# EAGLE design source_eagle (EAGLE 6.3)
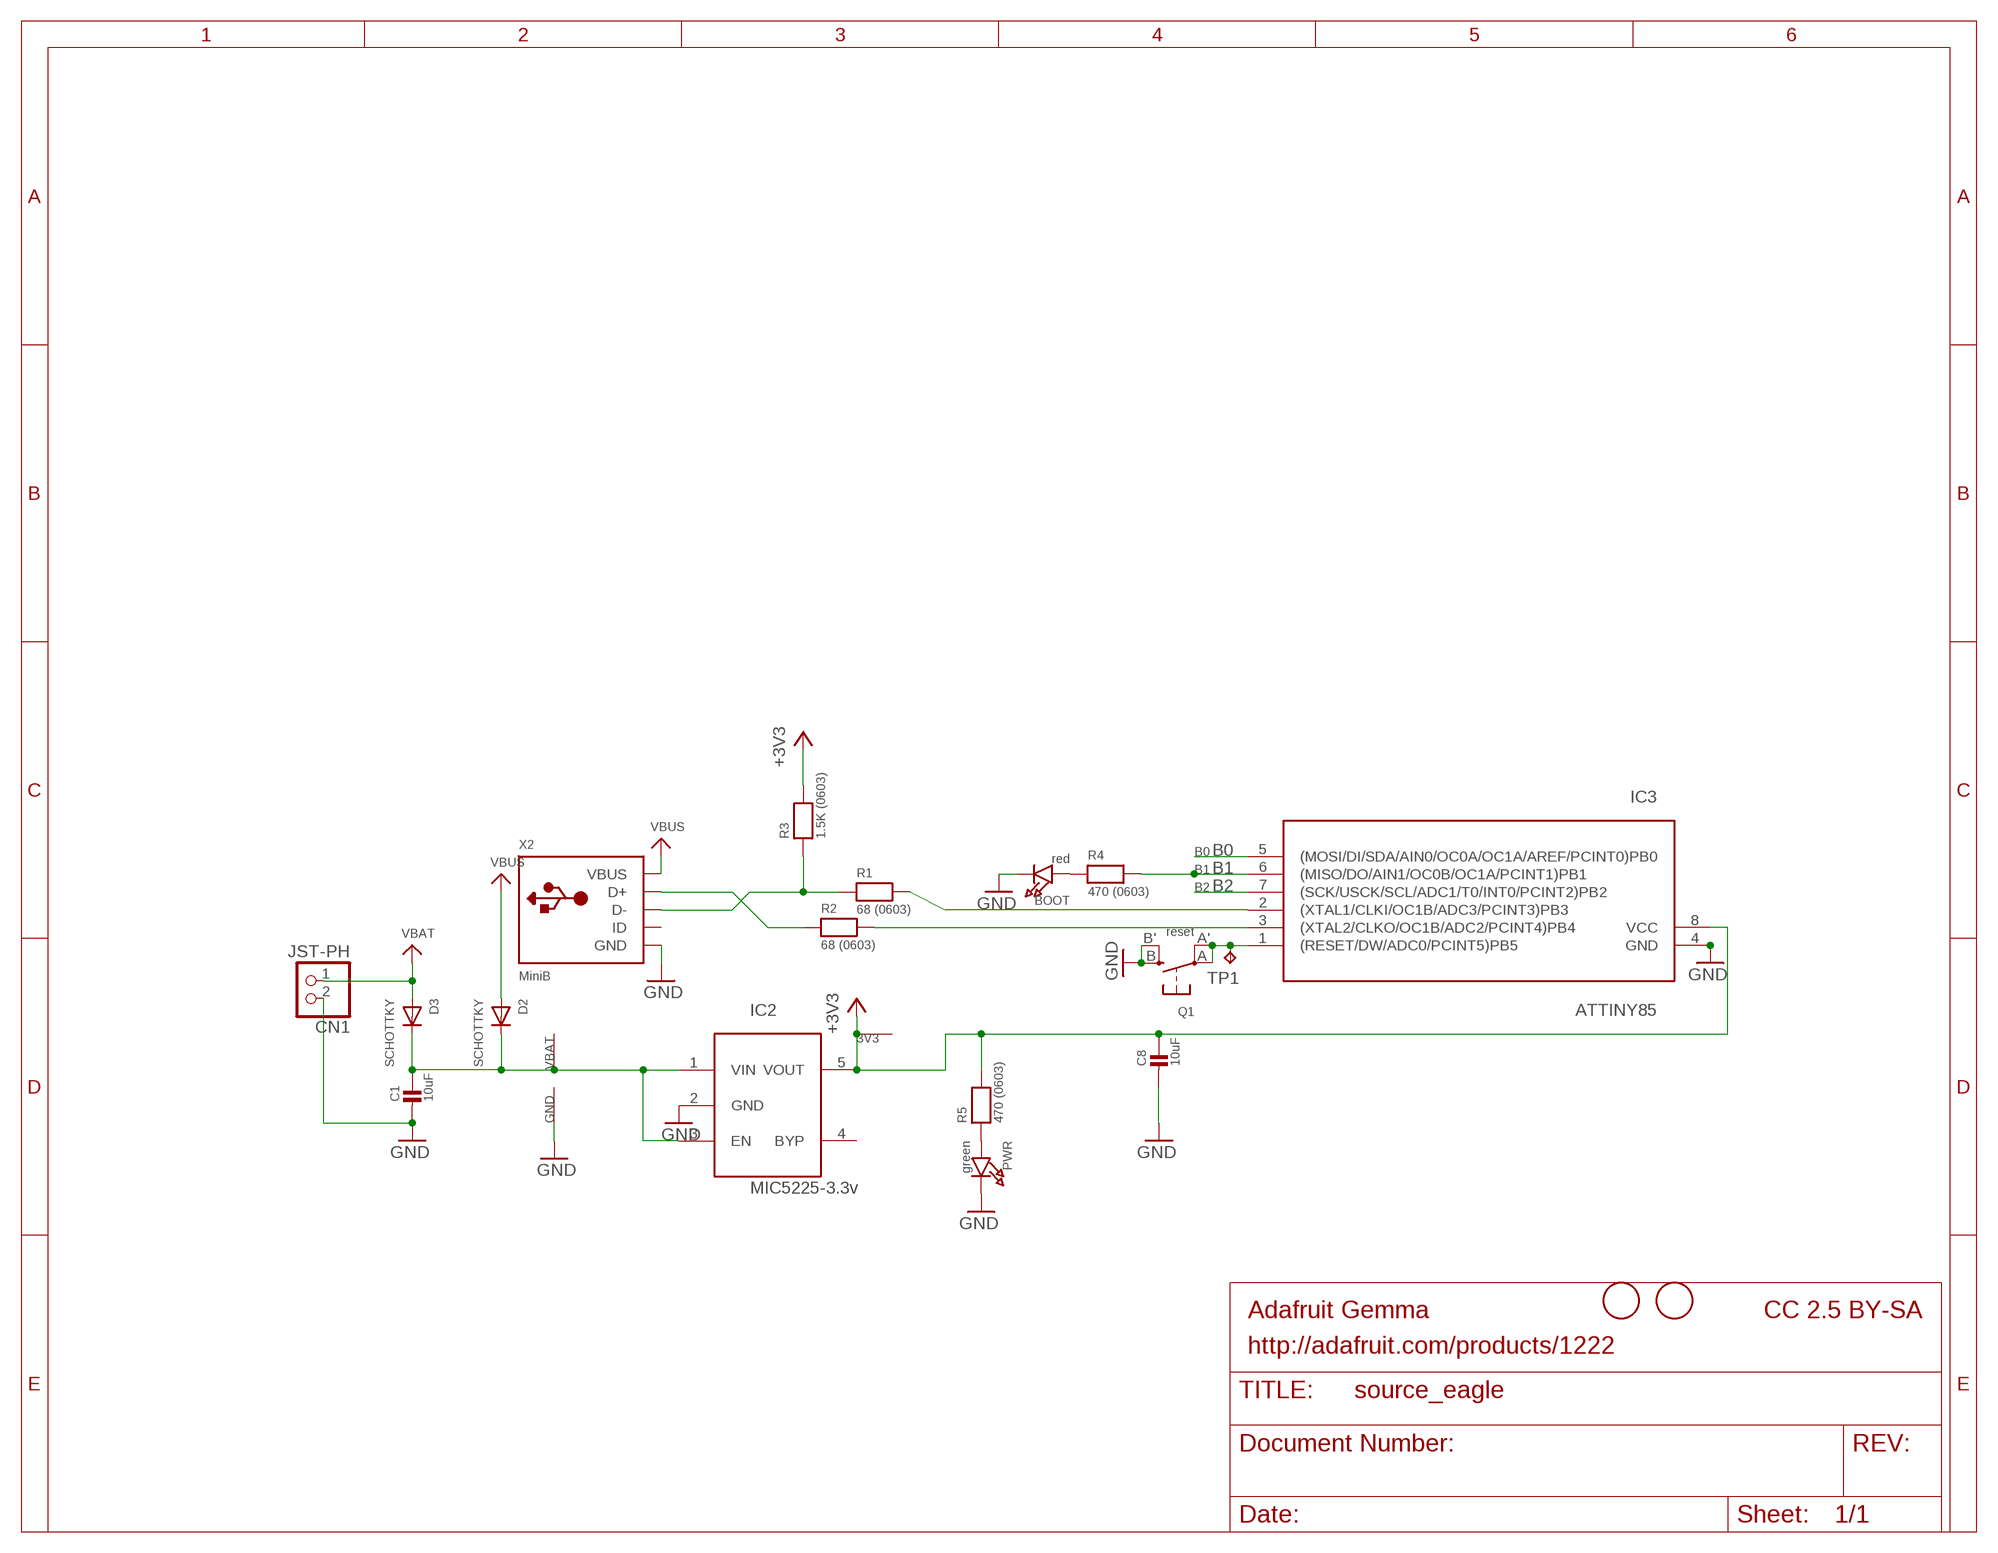
[diagram p0: schematic, sheet 1]

## Parts
3V3  SEWTAP-2.0IN  [SEWINGTAP_2.0]
B0  SEWTAP-2.0IN  [SEWINGTAP_2.0]
B1  SEWTAP-2.0IN  [SEWINGTAP_2.0]
B2  SEWTAP-2.0IN  [SEWINGTAP_2.0]
BOOT  red  LED0805_NOOUTLINE  [CHIPLED_0805_NOOUTLINE]
C1  10uF  CAP_CERAMIC0805-NOOUTLINE  [0805-NO]
C8  10uF  CAP_CERAMIC0805-NOOUTLINE  [0805-NO]
CN1  JST-PH  JST_2PIN-SMT-RA  [JST-PH-2-SMT-RA]
D2  SCHOTTKY  DIODE_SOD-123FL  [SOD-123FL]
D3  SCHOTTKY  DIODE_SOD-123FL  [SOD-123FL]
GND  SEWTAP-2.0IN  [SEWINGTAP_2.0]
IC2  MIC5225-3.3v  LP298XS  [SOT23-5L]
IC3  ATTINY85  ATTINY85V-10S  [SOIC8]
PWR  green  LED0805_NOOUTLINE  [CHIPLED_0805_NOOUTLINE]
Q1  reset  SWITCH_TACT_SMT4.6X2.8  [BTN_KMR2_4.6X2.8]
R1  68 (0603)  RESISTOR_0603_NOOUT  [0603-NO]
R2  68 (0603)  RESISTOR_0603_NOOUT  [0603-NO]
R3  1.5K (0603)  RESISTOR_0603_NOOUT  [0603-NO]
R4  470 (0603)  RESISTOR_0603_NOOUT  [0603-NO]
R5  470 (0603)  RESISTOR_0603_NOOUT  [0603-NO]
TP1  TPB2,54  [B2,54]
U$1  FIDUCIAL  [FIDUCIAL_1MM]
U$6  FIDUCIAL  [FIDUCIAL_1MM]
VBAT  SEWTAP-2.0IN  [SEWINGTAP_2.0]
X2  MiniB  USB_MEDIUM  [USB-MINI_MEDIUM]

## Nets
+3V3: 3V3.P$1(SEW) C8.1 IC2.5(VOUT) IC3.8(VCC) R3.2 R5.2
B0: B0.P$1(SEW) IC3.5((MOSI/DI/SDA/AIN0/OC0A/OC1A/AREF/PCINT0)PB0)
B1: B1.P$1(SEW) IC3.6((MISO/DO/AIN1/OC0B/OC1A/PCINT1)PB1) R4.2
B2: B2.P$1(SEW) IC3.7((SCK/USCK/SCL/ADC1/T0/INT0/PCINT2)PB2)
GND: BOOT.C C1.2 C8.2 CN1.2 GND.P$1(SEW) IC2.2(GND) IC3.4(GND) PWR.C Q1.B'(S1) Q1.B(S) X2.GND X2.GND1(GND) X2.GND2(GND) X2.GND3(GND) X2.GND4(GND)
N$1: IC3.1((RESET/DW/ADC0/PCINT5)PB5) Q1.A'(P1) Q1.A(P) TP1.TP
N$2: R2.1 X2.D+
N$3: IC3.2((XTAL1/CLKI/OC1B/ADC3/PCINT3)PB3) R1.2
N$4: IC3.3((XTAL2/CLKO/OC1B/ADC2/PCINT4)PB4) R2.2
N$5: R1.1 R3.1 X2.D-
N$6: BOOT.A R4.1
N$7: C1.1 D2.C D3.C IC2.1(VIN) IC2.3(EN) VBAT.P$1(SEW)
N$8: PWR.A R5.1
VBAT: CN1.1 D3.A
VBUS: D2.A X2.VBUS
Unconnected: IC2.4(BYP) X2.ID

## Notes on the sheet
- Adafruit Gemma | CC 2.5 BY-SA
- http://adafruit.com/products/1222

## Library data of the parts
3V3 B0 B1 B2 GND VBAT = adafruit:SEWTAP
BOOT PWR = microbuilder:LED: LED 0603 - 0603 Surface Mount Package 2mA: Green LED - Low Power (3.9mcd, 2ma, 1.7Vf) - Digikey: 475-2709-2-ND Orange LED - Low Power (9.8mcd, 2ma, 1.8Vf) - Digikey: 475-1194-2-ND Red LED - Low Power (5mcd, 2ma, 1.8Vf) - Digikey: 475-1195-2-ND Yellow LED - Low Power (7mcd, 2ma, 1.8Vf) - Digikey: 475-1196-2-ND 5mA: Blue LED - Low Power (17mcd, 5ma, 2.9Vf) - Digikey: LNJ937W8CRACT-ND 0805 - 0805 Surface Mount Package 2mA: Red LED (8.8mcd, 2mA, 1.8Vf, Clear) - Low Power [Digikey: 475-2510-1-ND] Green LED (5mcd, 2mA, 1.8Vf, Clear) - Low Power [Digikey: 475-2730-1-ND] Yellow LED (11.3mcd, 2mA, 1.8Vf, Clear) - Low Power [Digikey: 475-2555-1-ND] 20mA: Red LED (104mcd, 20mA, Diffused) - LS R976 [Digikey: 475-1278-6-ND] Red LED (12mcd, 20mA, 2.0Vf, Clear) - APT2012EC [Digikey: 754-1128-1-ND] Green LED (15mcd, 20mA, 2.2Vf, Clear) - APT2012GC [Digikey: 754-1131-1-ND] Orange LED (160mcd, 20mA, 2.1Vf, Clear) - APT2012SECK [Digikey: 754-1130-1-ND] 1206 - 1206 Surface Mount Package Green LED (26mcd, 20mA, Diffused) - LG N971 [Digikey: 475-1407-6-ND] Red LED (15mcd, 20mA, Diffused) - LH N974 [Digikey: 475-1416-6-ND] Cree - Cree High-Power Surface Mount LEDs XPEBWT-L1-0000-00D50 - White 111lm 350mA 2.9Vf 6200K 110° XTEAWT-00-0000-00000LEE3 - White 114lm 350mA 2.85Vf 5000K 115° Everlight - Everlight 45-21 Series Surface Mount LEDs 45-21/QK2C-B2832AC2CB2/2T - Warm White 2000mcd 20mA 3.25Vf 3050K 120° 45-21/LK2C-B38452C4CB2/2T - Nuetral White 2000mcd 20mA 3.25Vf 4150K 120° 45-21/LK2C-B50634C6CB2/2T - Cold White 2200mcd 20mA 3.25Vf 5650K 120° PLCC2 Reverse Mount LS T77K-J1L2-1-0-2-R18-Z - Red 11.25mcd 2mA 1.8Vf 630nm 120° LO T77K-L1M2-24-Z - Orange 19.6mcd 2mA 1.8Vf 606nm 120° LY T77K-K2M1-26-Z - Yellow 15.7mcd 2mA 1.8Vf 587nm 120°
C1 C8 = microbuilder:CAP_CERAMIC: Ceramic Capacitors For new designs, use the packages preceded by an '_' character since they are more reliable: The following footprints should be used on most boards: _0402 - Standard footprint for regular board layouts _0603 - Standard footprint for regular board layouts _0805 - Standard footprint for regular board layouts For extremely tight-pitch boards where space is at a premium, the following 'micro-pitch' footprints can be used (smaller pads, no silkscreen outline, etc.): _0402MP - Micro-pitch footprint for very dense/compact boards _0603MP - Micro-pitch footprint for very dense/compact boards _0805MP - Micro-pitch footprint for very dense/compact boards Commonly Stocked Parts 0402 - 0402 Surface Mount Capacitors 16pF 50V 5% [Digikey: 445-4899-2-ND] 18pF 50V 5% [Digikey: 490-1281-2-ND] 22pF 50V 5% [Digikey: 490-1283-2-ND] 68pF 50V 5% [Digikey: 490-1289-2-ND] 0.1uF 10V 10% [Digikey: 490-1318-2-ND] 1.0uF 6.3V 10% [Digikey: 490-1320-2-ND] 0603 - 0603 Surface Mount Capacitors 16 pF 50V 5% [Digikey: 445-5051-2-ND] 22 pF 50V [Digikey: PCC220ACVTR-ND] 33 pF 50V 5% [Digikey: 490-1415-1-ND] 56pF 50V 5% [Digikey: 490-1421-1-ND] 220pF 50V 5% [Digikey: 445-1285-1-ND] 680 pF 50V 2200 pF 50V 5% C0G [Digikey: 445-1297-1-ND] 5600 pF 100V 5% X7R [Digikey: 478-3711-1-ND] 0.1 µF 25V 10% [Digikey: PCC2277TR-ND] 0.22 µF 16V 10% X7R [Digikey: 445-1318-1-ND] 1.0 µF 25V 10% [Digikey: 445-5146-2-ND] 0603 - RF Specific 3pF 250V +/-0.1pF RF [Digikey: 712-1347-1-ND] 18 pF 250V 5% [Digikey: 478-3505-1-ND or 712-1322-1-ND] 56 pF 250V 5% C0G RF [Digikey: 490-4867-1-ND] 68 pF 250V RF [Digikey: 490-4868-1-ND] 0805 - 0805 Surface Mount Capacitors 220 pF 250V 2% RF Ceramic Capacitor [Digikey: 712-1398-1-ND] 1000 pF 50V 2% NP0 Ceramic Capacitor [Digikey: 478-3760-1-ND] 0.1 µF 25V 10% Ceramic Capacitor [Digikey: PCC1828TR-ND] 1.0 µF 16V 10% Ceramic Capacitor[Digikey: 490-1691-2-ND] 10.0 µF 10V 10% Ceramic Capacitor[Digikey: 709-1228-1-ND] 10.0 uF 16V 10% Ceramic Capacitor [Digikey: 478-5165-2-ND] 47 uF 6.3V 20% Ceramic Capacitor [Digikey: 587-1779-1-ND or 399-5506-1-ND] 1206 - 1206 Surface Mount Capacitors 47uF 10V 20% Ceramic Capacitor [Digikey: 490-5528-1-ND or 399-5508-1-ND or 445-6010-1-ND] 100uF 6.3V -20%, +80% Y5V Ceramic Capacitor (Digikey: 490-4512-1-ND, Mouser: 81-GRM31CF50J107ZE1L)
CN1 = adafruit:JST_2PIN: JST 2-Pin Connectors of various flavors SMT-RA (S2B-PH-SM4) 4UConnector #17311 SMT (B2B-PH-SM4) THM-RA (S2B-PH) THM (B2B-PH)
D2 D3 = adafruit:DIODE: Diode SMADIODE - SMA Surface Mount Package 20V 1A Schottky Diode Digikey: 641-1014-6-ND DO-1N4148 - Through Hole Small Current Diode SOD-123 20V 1 A (.5mV Vf) Schottky Diode - Digikey: MBRX120TPMSCT-ND SOD-323 10V 570mA (.38mV Vf, 3ns) Schottky Diode - Digikey: ZLLS410CT-ND SOD-523 30V 30mA Schottky Diode (RB751S-40TE61) - Digikey: RB751S-40TE61CT-ND SOT23-R/W - SOT23 Package (R = Solder Paste/Reflow Ovens, W = Hand-Soldering) BAT54Film 40V 300mA - Digikey: 497-7162-1-ND
IC2 = adafruit:LP298X
IC3 = avr:ATTINY85: MICROCONTROLLER 8 Kbytes FLASH 512 bytes EEPROM 512 bytes RAM 4-channel 10 bit ADC USI
Q1 = microbuilder:SWITCH_TACT_SMT: SMT Tact Switches 6x6mm - Digikey: P12940SCT-ND KMR2 (4.6x2.8mm) - Digikey: 401-1426-1-ND EVQ-PQHB55 - Light Touch, 160GF (4.5x4.5mm) - Digikey: P8090SCT-ND KMT0 - KMT021 NGJ LHS (etc.) IP68/Waterproof - Digikey: CKN10289CT-ND
R1-R5 = microbuilder:RESISTOR: Resistors For new designs, use the packages preceded by an '_' character since they are more reliable: The following footprints should be used on most boards: _0402 - Standard footprint for regular board layouts _0603 - Standard footprint for regular board layouts _0805 - Standard footprint for regular board layouts For extremely tight-pitch boards where space is at a premium, the following 'micro-pitch' footprints can be used (smaller pads, no silkscreen outline, etc.): _0402MP - Micro-pitch footprint for very dense/compact boards _0603MP - Micro-pitch footprint for very dense/compact boards _0805MP - Micro-pitch footprint for very dense/compact boards
TP1 = testpad:TP: Test pad
U$1 U$6 = adafruit:FIDUCIAL: For use by pick and place machines to calibrate the vision/machine, 1mm By microbuilder.eu
X2 = microbuilder:USB: USB Connectors USBMINIB - Surface Mount Female Mini-B USB Connector 4UConnector: 06564

## Board
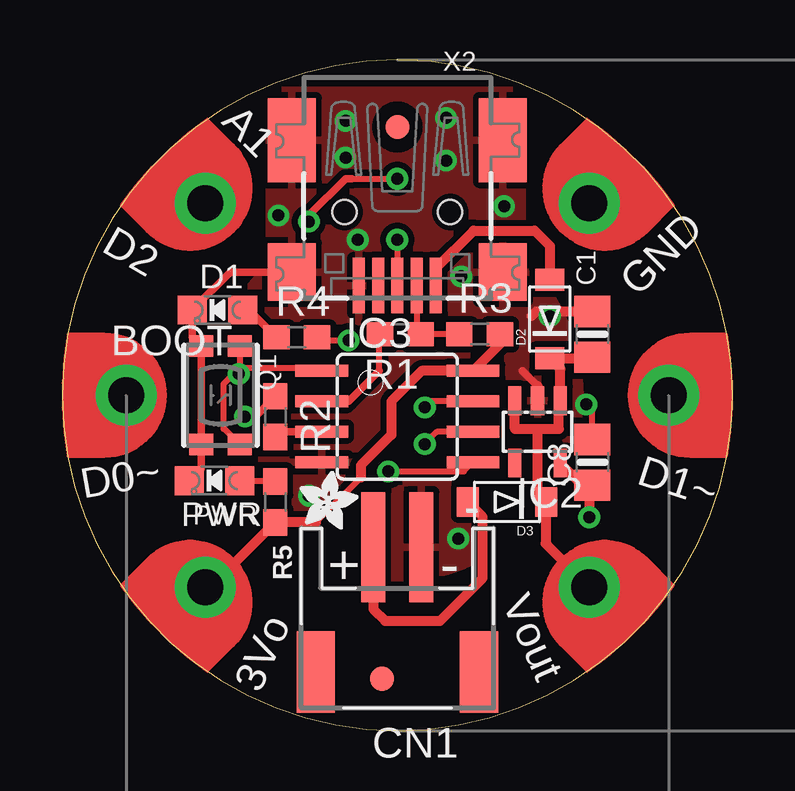
[diagram p1: board, top side]
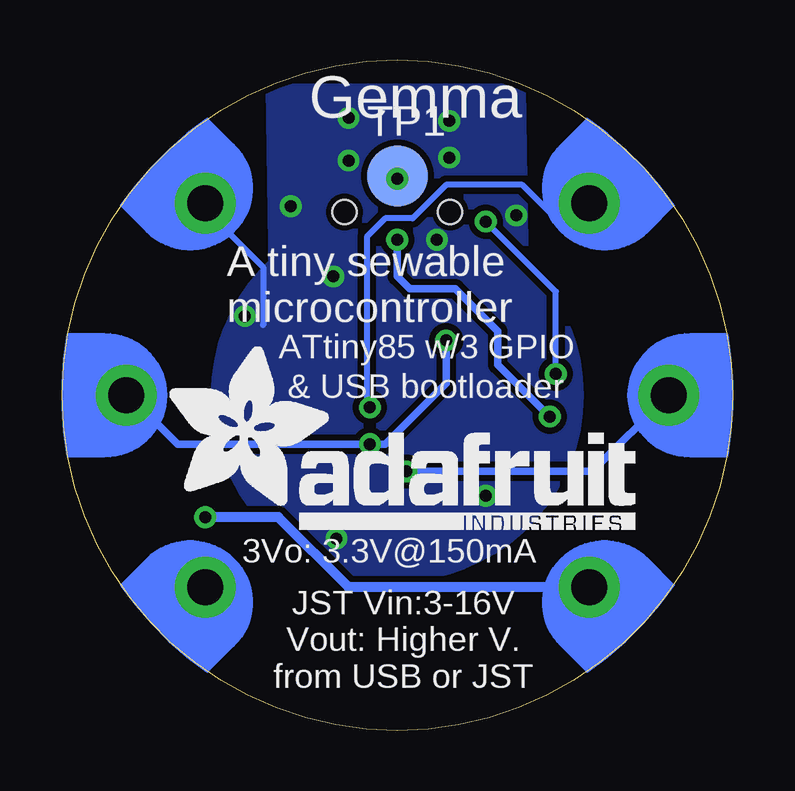
[diagram p2: board, bottom side, seen from below]

Size 27.94 x 27.94 mm. Coordinates in mm from the lower left corner, seen from the top.
Outline: 0,13.97 arc90 13.97,0 arc90 27.94,13.97 arc90 13.97,27.94 arc90 0,13.97
Copper layers (1*16): Top 0.035mm / dielectric 1.5mm / Bottom 0.035mm
Design rules "adafruit *": minimum track width 8mil, minimum drill 15.5mil, track to track 10mil, track to pad 10mil, pad to pad 12mil, via to via 10mil, smd to smd 8mil, copper to edge 10mil, drill to drill 8mil, minimum pad ring 10mil, minimum via ring 8mil, stop-mask expansion 4mil, vias tented up to drill 20mil, thermal gap 10mil

### Footprints (pad centres in the part's own frame; a part is rotated, then mirrored left to right if it is on the bottom)
SEWINGTAP_2.0 = drill 1.5 pad 2.54: P$1 0,0
CHIPLED_0805_NOOUTLINE = smd 1.2 x 1.2: A 0,-1.05; C 0,1.05
0805-NO = smd 1.3 x 1.5: 1 -0.95,0; 2 0.95,0
JST-PH-2-SMT-RA = smd 1 x 4.6: 1 1,-3.7; 2 -1,-3.7 | smd 1.6 x 3.4: NC1 -3.4,1.5; NC2 3.4,1.5
SOD-123FL = smd 0.91 x 1.22: A 1.637,0; C -1.637,0
SOT23-5L = smd 0.55 x 1.2: 1 -0.95,-1.3; 2 0,-1.3; 3 0.95,-1.3; 4 0.95,1.3; 5 -0.95,1.3
SOIC8 = smd 0.5 x 2.2: 1 -1.905,-3.154; 2 -0.645,-3.154; 3 0.625,-3.154; 4 1.895,-3.154; 5 1.905,3.154; 6 0.635,3.154; 7 -0.635,3.154; 8 -1.905,3.154
BTN_KMR2_4.6X2.8 = smd 0.9 x 1: A 2.05,0.8; A' -2.05,0.8; B 2.05,-0.8; B' -2.05,-0.8
0603-NO = smd 1.1 x 1: 1 -0.85,0; 2 0.85,0
B2,54 = smd 2.54 x 2.54: TP 0,0
FIDUCIAL_1MM = smd 1 x 1: 1 0,0
USB-MINI_MEDIUM = smd 0.5 x 2.308: D+ 0,4.064; D- -0.8,4.064; GND 1.6,4.064; ID 0.8,4.064; VBUS -1.6,4.064 | smd 2 x 3.5: GND1 -4.4,-2; GND4 4.4,-2 | smd 2 x 2.4: GND2 -4.4,3.5; GND3 4.4,3.5 | hole 1: -2.2,1; 2.2,1

### Placement (x,y rotation side)
3V3  5.97,5.97 135 top
B0  2.67,13.97 90 top
B1  25.27,13.97 270 top
B2  5.97,21.97 45 top
BOOT  6.48,17.53 90 top
C1  22.1,16.51 90 top
C8  22.1,11.18 90 top
CN1  13.97,3.94 180 top
D2  20.32,17.14 90 top
D3  18.54,9.53 180 top
GND  21.97,21.97 315 top
IC2  19.81,12.45 180 top
IC3  13.97,13.08 270 top
PWR  6.35,10.41 90 top
Q1  6.6,13.97 270 top
R1  14.1,16.51 180 top
R2  8.89,13.08 270 top
R3  17.4,16.51 0 top
R4  9.78,16.38 0 top
R5  8.89,9.53 270 top
TP1  13.97,23.11 0 bottom
U$1  13.97,25.15 0 top
U$2  [ADAFRUIT_2.5MM]  9.91,8.38 0 top
U$6  13.34,2.16 0 top
U$7  [ADAFRUIT_TEXT_20MM]  23.62,8.38 0 bottom
VBAT  21.97,5.97 225 top
X2  13.97,22.61 180 top

### Tracks (layer width: path | path; a pad name or v marks a point on that pad's centre or on a via)
+3V3  (via drill 0.5)
  Top 0.254: 3V3.P$1 6.18,5.97 | 12.45,10.54 10.58,8.68
  Top 0.406: IC2.5 21.68,10.23 C8.1 21.97,10.1 v21.97,8.89 | 17.51,14.99 IC3.8 | IC3.8 14.99,14.99 13.72,13.72 13.72,12.32 12.45,11.05 12.45,10.54 | 10.58,8.68 R5.2 6.18,5.97 | R3.2 18.25,16.11 IC3.8
  Bottom 0.406: 3V3.P$1 16,5.97 18.92,8.89 v21.97,8.89
B0  (via drill 0.5)
  Top 0.254: v13.59,10.8 16.74,10.8 IC3.5
  Bottom 0.305: B0.P$1 5.84,10.8 v13.59,10.8
B1  (via drill 0.5)
  Top 0.254: R4.2 10.76,16.26 v11.94,16.26 | IC3.6 15.62,12.45 v15.11,11.94
  Bottom 0.254: 25.27,13.59 B1.P$1
  Bottom 0.305: B1.P$1 25.15,13.97 23.11,11.94 v15.11,11.94 14.48,11.94 11.94,14.48 v11.94,16.26
B2  (via drill 0.5)
  Top 0.254: IC3.7 15.37,13.72 v15.11,13.46
  Bottom 0.254: B2.P$1 5.97,21.59 7.62,21.59 8.76,22.73 11.94,22.73 13.34,21.34 14.48,21.34 15.24,20.57 15.24,13.59 v15.11,13.46
GND  (via drill 0.5)
  Top 0.254: GND.P$1 22.1,21.84 | 10.18,9.67 v10.29,9.78 | C8.2 22.1,13.34 v21.84,13.59 | 19.81,14.22 IC2.2
  Top 0.305: PWR.C 5.8,10.92 Q1.B Q1.B' 5.43,16.4 BOOT.C 7.01,19.11 X2.GND3 | 19.81,14.35 19.18,14.99
  Top 0.406: C1.2 19.75,17.46 19.56,17.27 | IC2.2 19.81,14.35
  Bottom 0.254: 19.56,16.89 19.56,19.3 21.97,21.72 GND.P$1 | v21.84,13.59 21.21,13.59
  other vias: 12.32,20.45 16.51,8 11.81,25.4 16,25.53 16,23.75 18.41,21.84 11.81,23.88 16.64,18.92 9.02,21.46 20.32,17.27
  pour Bottom: 6.35,13.97 arc90 13.97,6.35 arc90 21.59,13.97 arc90 13.97,21.59 arc90
  pour Bottom: 8.76,26.8 8.64,18.92 19.18,18.92 19.3,26.8
  pour Top: 6.35,13.97 arc90 13.97,6.35 arc90 21.59,13.97 arc90 13.97,21.59 arc90
  pour Top: 8.64,26.67 8.64,18.92 19.18,18.92 19.18,26.67
N$1  (via drill 0.5)
  Top 0.254: Q1.A' 7.4,15.11 | 7.4,15.11 7.37,15.11 v7.37,14.86 | 7.4,15.11 6.73,14.44 6.73,12.57 6.75,12.57 Q1.A | 12.07,22.99 v13.97,22.99 | 7.4,15.11 10.69,15.11 IC3.1
  Top 0.305: 12.07,22.99 11.81,22.99 10.29,21.46 v10.29,21.21
  Bottom 0.254: v7.37,14.86 7.37,18.29 v10.29,21.21 | 14.48,22.61 14.35,22.61 v13.97,22.99 TP1.TP
N$2  (via drill 0.5)
  Top 0.254: v13.97,20.45 X2.D+
  Top 0.305: R2.1 8.04,13.08 v7.62,13.08
  Bottom 0.305: v7.62,13.08 9.78,15.24 9.78,16.64 11.56,18.41 13.46,18.41 13.97,18.92 v13.97,20.45
N$3
  Top 0.254: 11.95,13.73 IC3.2 | 13.21,14.99 13.21,16.47 R1.2
  Top 0.305: 11.95,13.73 13.21,14.99
N$4
  Top 0.305: IC3.3 9.12,12.46 R2.2
N$5
  Top 0.254: R3.1 R1.1 14.77,16.69 X2.D-
N$6
  Top 0.305: BOOT.A 7.79,17.53 R4.1
N$7
  Top 0.254: 21.94,15.4 C1.1
  Top 0.406: 19.81,12.57 18.86,12.57 IC2.3 | 19.81,12.57 20.7,12.57 20.7,13.75 IC2.1 20.76,15.07 D2.C 22.05,15.51 C1.1 | 19.81,12.57 19.81,9.85 19.85,9.85 D3.C 20.18,7.8 20.14,7.8 VBAT.P$1
N$8
  Top 0.254: PWR.A 8.85,10.41 R5.1
VBAT
  Top 0.406: CN1.1 12.97,5.06 13.46,4.57 15.75,4.57 17.53,6.35 17.53,8.9 D3.A
VBUS
  Top 0.406: X2.VBUS 15.57,19.25 17.14,20.83 19.69,20.83 20.32,20.19 D2.A

### Text on the board
tPlace: A1 | D2 | D1 | GND | D0~ | D1~ | PWR | + | - | Vout | 3Vo
bPlace: Gemma | A tiny sewable / microcontroller | ATtiny85 w/3 GPIO | & USB bootloader | 3Vo: 3.3V@150mA | JST Vin:3-16V / Vout: Higher V. / from USB or JST
tDocu: SCL/SCK | GND | SDA/MOSI | MISO | 3-16VDC